# EAGLE schematic tranc_1 (EAGLE 6.5.0)
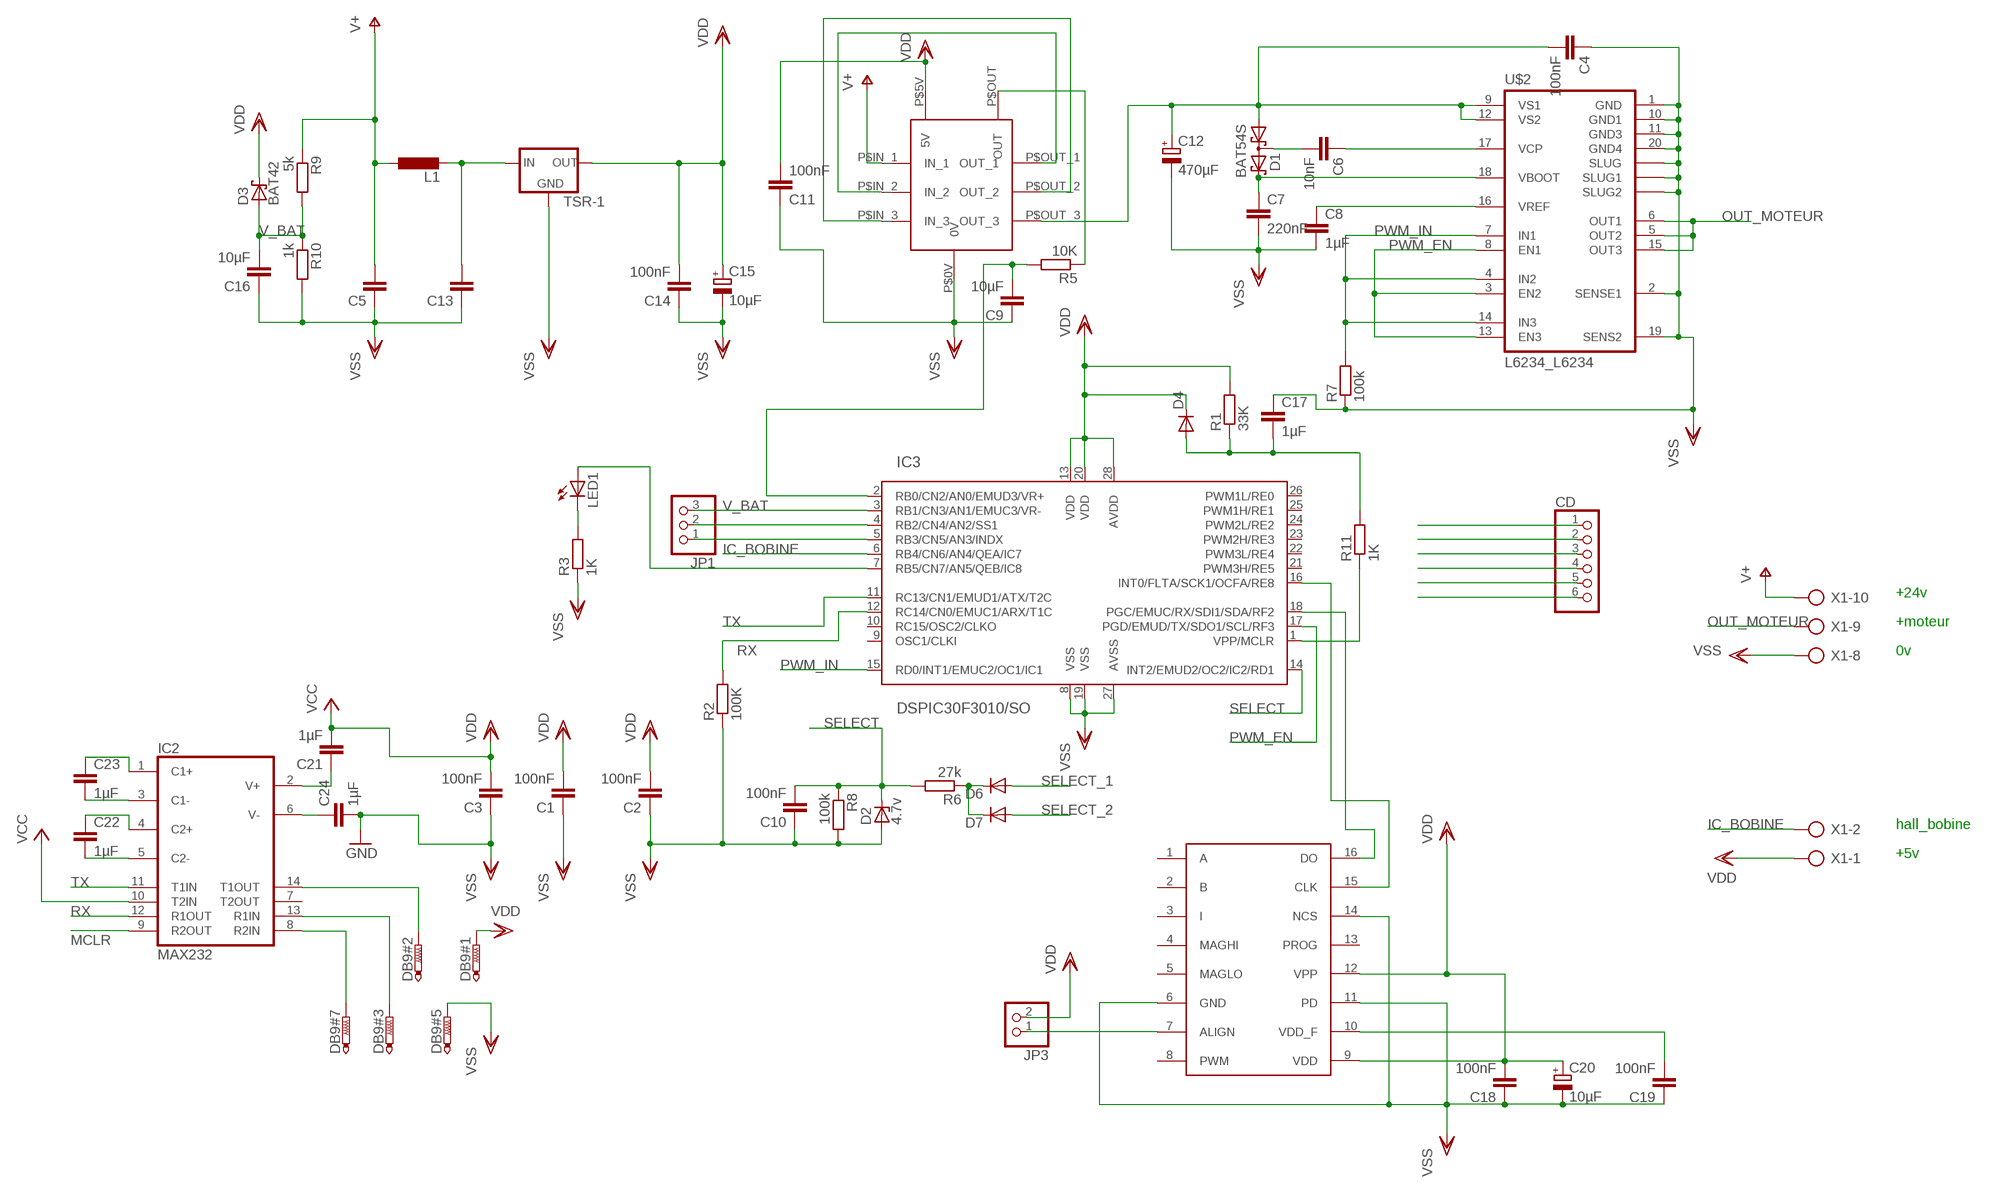
[diagram p0: schematic, sheet 1]

## Parts
C1  100nF  C-EUC0805K  [C0805K]
C2  100nF  C-EUC0805K  [C0805K]
C3  100nF  C-EUC0805K  [C0805K]
C4  100nF  C-EUC0805K  [C0805K]
C5  C-EUC1206K  [C1206K]
C6  10nF  C-EUC0805K  [C0805K]
C7  220nF  C-EUC0805K  [C0805K]
C8  1µF  C-EUC0805K  [C0805K]
C9  10µF  C-EUC1812  [C1812]
C10  100nF  C-EUC0805K  [C0805K]
C11  100nF  C-EUC0805K  [C0805K]
C12  470µF  CPOL-EUTT5D11L  [TT5D11L]
C13  C-EUC1206K  [C1206K]
C14  100nF  C-EUC0805K  [C0805K]
C15  10µF  CPOL-EUSMCB  [SMC_B]
C16  10µF  C-EUC0805K  [C0805K]
C17  1µF  C-EUC0805K  [C0805K]
C18  100nF  C-EUC0805K  [C0805K]
C19  100nF  C-EUC0805K  [C0805K]
C20  10µF  CPOL-EUSMCB  [SMC_B]
C21  1µF  C-EUC0805K  [C0805K]
C22  1µF  C-EUC0805K  [C0805K]
C23  1µF  C-EUC0805K  [C0805K]
C24  1µF  C-EUC0805K  [C0805K]
CD  PINHD-1X6  [1X06]
D1  BAT54S  [SOT23]
D2  4.7v  1N4728  [DO41Z10]
D3  BAT42  [DO35-10]
D4  DIODE-MINIMELF  [MINIMELF]
D6  DIODE-MINIMELF  [MINIMELF]
D7  DIODE-MINIMELF  [MINIMELF]
DB9#1  PTR1TP16SQ  [TP16SQ]
DB9#2  PTR1TP16SQ  [TP16SQ]
DB9#3  PTR1TP16SQ  [TP16SQ]
DB9#5  PTR1TP16SQ  [TP16SQ]
DB9#7  PTR1TP16SQ  [TP16SQ]
IC2  MAX232  [SO16]
IC3  DSPIC30F3010/SO  [SO-28W]
JP1  PINHD-1X3  [1X03]
JP3  PINHD-1X2  [1X02]
L1  L-EUL2012C  [L2012C]
LED1  LEDCHIPLED_1206  [CHIPLED_1206]
R1  33K  R-EU_M0805  [M0805]
R2  100K  R-EU_M0805  [M0805]
R3  1K  R-EU_M0805  [M0805]
R5  10K  R-EU_M0805  [M0805]
R6  27k  R-EU_M0805  [M0805]
R7  100k  R-EU_M0805  [M0805]
R8  100k  R-EU_M0805  [M0805]
R9  5k  R-EU_M0805  [M0805]
R10  1k  R-EU_M0805  [M0805]
R11  1K  R-EU_M0805  [M0805]
TSR-1  78XXS  [78XXS]
U$1  LTS25-NP  [LTS25]
U$2  L6234_L6234  [L6234_SO20POWER2]
U$3  AVAGO_AEAT-6600TSSOP16  [AVAGO_TSSOP16]
X1  AK300/10  [AK300/10]

## Nets
IC_BOBINE: IC3.6(RB4/CN6/AN4/QEA/IC7) X1.2
MCLR: IC2.9(R2OUT) IC3.1(VPP/MCLR) R11.1
N$1: C13.2 L1.2 TSR-1.IN
N$2: U$1.P$IN_2(IN_2) U$1.P$OUT_1(OUT_1)
N$3: IC3.16(INT0/FLTA/SCK1/OCFA/RE8) U$3.15(CLK)
N$4: CD.1
N$5: U$1.P$IN_3(IN_3) U$1.P$OUT_2(OUT_2)
N$6: IC3.7(RB5/CN7/AN5/QEB/IC8) LED1.A
N$7: C4.2 C12.+ D1.1(A1) U$1.P$OUT_3(OUT_3) U$2.9(VS1) U$2.12(VS2)
N$8: R5.1 U$1.P$OUT(OUT)
N$9: C17.2 D4.A R1.1 R11.2
N$10: C6.2 D1.3(C1A2)
N$11: C6.1 U$2.17(VCP)
N$12: C7.1 D1.2(C2) U$2.18(VBOOT)
N$13: C8.1 U$2.16(VREF)
N$14: JP3.1 U$3.7(ALIGN)
N$15: CD.2
N$16: D6.C D7.C R6.1
N$17: IC3.18(PGC/EMUC/RX/SDI1/SDA/RF2) U$3.16(DO)
N$18: CD.3
N$19: CD.4
N$20: CD.5
N$21: CD.6
N$23: LED1.C R3.2
N$24: IC3.4(RB2/CN4/AN2/SS1) JP1.2
N$25: IC3.5(RB3/CN5/AN3/INDX) JP1.1
N$27: C23.1 IC2.1(C1+)
N$28: C23.2 IC2.3(C1-)
N$29: C22.2 IC2.5(C2-)
N$30: C9.2 IC3.2(RB0/CN2/AN0/EMUD3/VR+) R5.2
N$31: C19.2 U$3.10(VDD_F)
N$32: C22.1 IC2.4(C2+)
N$33: C21.1 IC2.2(V+)
N$34: C24.1 IC2.6(V-)
N$35: DB9#2.TP IC2.14(T1OUT)
N$36: DB9#3.TP IC2.13(R1IN)
N$37: DB9#7.TP IC2.8(R2IN)
OUT_MOTEUR: U$2.5(OUT2) U$2.6(OUT1) U$2.15(OUT3) X1.9
PWM_EN: IC3.17(PGD/EMUD/TX/SDO1/SCL/RF3) U$2.3(EN2) U$2.8(EN1) U$2.13(EN3)
PWM_IN: IC3.15(RD0/INT1/EMUC2/OC1/IC1) R7.2 U$2.4(IN2) U$2.7(IN1) U$2.14(IN3)
RX: IC2.12(R1OUT) IC3.12(RC14/CN0/EMUC1/ARX/T1C) R2.2
SELECT: C10.2 D2.C IC3.14(INT2/EMUD2/OC2/IC2/RD1) R6.2 R8.1
SELECT_1: D6.A
SELECT_2: D7.A
TX: IC2.11(T1IN) IC3.11(RC13/CN1/EMUD1/ATX/T2C)
V+: C5.2 L1.1 R9.1 U$1.P$IN_1(IN_1) X1.10
V_BAT: C16.2 D3.A IC3.3(RB1/CN3/AN1/EMUC3/VR-) JP1.3 R9.2 R10.1
VCC: IC2.10(T2IN)
VDD: C1.2 C2.2 C3.2 C11.2 C14.2 C15.+ C18.2 C20.+ C21.2 D3.C D4.C DB9#1.TP IC3.13(VDD) IC3.20(VDD) IC3.28(AVDD) JP3.2 R1.2 TSR-1.OUT U$1.P$5V(5V) U$3.9(VDD) U$3.12(VPP) X1.1 ; supply symbol labelled VCC
VSS: C1.1 C2.1 C3.1 C4.1 C5.1 C7.2 C8.2 C9.1 C10.1 C11.1 C12.- C13.1 C14.1 C15.- C16.1 C17.1 C18.1 C19.1 C20.- C24.2 D2.A DB9#5.TP IC3.8(VSS) IC3.19(VSS) IC3.27(AVSS) R2.1 R3.1 R7.1 R8.2 R10.2 TSR-1.GND U$1.P$0V(0V) U$2.1(GND) U$2.2(SENSE1) U$2.10(GND1) U$2.11(GND3) U$2.19(SENS2) U$2.20(GND4) U$2.SLUG1(SLUG2) U$2.SLUG2(SLUG) U$2.SLUG(SLUG1) U$3.6(GND) U$3.11(PD) U$3.14(NCS) X1.8 ; supply symbol labelled GND
Unconnected: IC2.7(T2OUT) IC3.9(OSC1/CLKI) IC3.10(RC15/OSC2/CLKO) IC3.21(PWM3H/RE5) IC3.22(PWM3L/RE4) IC3.23(PWM2H/RE3) IC3.24(PWM2L/RE2) IC3.25(PWM1H/RE1) IC3.26(PWM1L/RE0) U$3.1(A) U$3.2(B) U$3.3(I) U$3.4(MAGHI) U$3.5(MAGLO) U$3.8(PWM) U$3.13(PROG) X1.3 X1.4 X1.5 X1.6 X1.7

## Notes on the sheet
- +24v
- +moteur
- 0v
- hall_bobine
- +5v

## Power pins joined to a net without a drawn wire
VDD: IC2.16(VCC)
VSS: IC2.15(GND)

## Library data of the parts
C1-C11 C13 C14 C16-C19 C21-C24 = rcl:C-EU: CAPACITOR, European symbol
C12 C15 C20 = rcl:CPOL-EU: POLARIZED CAPACITOR, European symbol
CD = pinhead:PINHD-1X6: PIN HEADER
D1 = diode:BAT54S: Schottky Diodes Pin connection corrected 2011-05-04 Source: Fairchild .. BAT54.pdf
D2 = diode:1N4728: Z DIODE 3.3 V, 1W, 5 percent
D3 = diode:BAT42: DIODE barrier diode
D4 D6 D7 = diode:DIODE-: DIODE
DB9#1-DB9#3 DB9#5 DB9#7 = testpad:PTR1: TEST PIN
IC2 = maxim:MAX232: RS232 TRANSCEIVER
IC3 = microchip-dspic:DSPIC30F3010: dsPIC Motion Controller DSC
JP1 = pinhead:PINHD-1X3: PIN HEADER
JP3 = pinhead:PINHD-1X2: PIN HEADER
L1 = rcl:L-EU: INDUCTOR, European symbol
LED1 = led:LED: LED OSRAM: - CHIPLED LG R971, LG N971, LY N971, LG Q971, LY Q971, LO R971, LY R971 LH N974, LH R974 LS Q976, LO Q976, LY Q976 LO Q996 - Hyper CHIPLED LW Q18S LB Q993, LB Q99A, LB R99A - SideLED LS A670, LO A670, LY A670, LG A670, LP A670 LB A673, LV A673, LT A673, LW A673 LH A674 LY A675 LS A676, LA A676, LO A676, LY A676, LW A676 LS A679, LY A679, LG A679 - Hyper Micro SIDELED® LS Y876, LA Y876, LO Y876, LY Y876 LT Y87S - SmartLED LW L88C, LW L88S LB L89C, LB L89S, LG L890 LS L89K, LO L89K, LY L89K LS L896, LA L896, LO L896, LY L896 - TOPLED LS T670, LO T670, LY T670, LG T670, LP T670 LSG T670, LSP T670, LSY T670, LOP T670, LYG T670 LG T671, LOG T671, LSG T671 LB T673, LV T673, LT T673, LW T673 LH T674 LS T676, LA T676, LO T676, LY T676, LB T676, LH T676, LSB T676, LW T676 LB T67C, LV T67C, LT T67C, LS T67K, LO T67K, LY T67K, LW E67C LS E67B, LA E67B, LO E67B, LY E67B, LB E67C, LV E67C, LT E67C LW T67C LS T679, LY T679, LG T679 LS T770, LO T770, LY T770, LG T770, LP T770 LB T773, LV T773, LT T773, LW T773 LH T774 LS E675, LA E675, LY E675, LS T675 LS T776, LA T776, LO T776, LY T776, LB T776 LHGB T686 LT T68C, LB T68C - Hyper Mini TOPLED® LB M676 - Mini TOPLED Santana® LG M470 LS M47K, LO M47K, LY M47K Source: http://www.osram.convergy.de LUXEON: - LUMILED® LXK2-PW12-R00, LXK2-PW12-S00, LXK2-PW14-U00, LXK2-PW14-V00 LXK2-PM12-R00, LXK2-PM12-S00, LXK2-PM14-U00 LXK2-PE12-Q00, LXK2-PE12-R00, LXK2-PE12-S00, LXK2-PE14-T00, LXK2-PE14-U00 LXK2-PB12-K00, LXK2-PB12-L00, LXK2-PB12-M00, LXK2-PB14-N00, LXK2-PB14-P00, LXK2-PB14-Q00 LXK2-PR12-L00, LXK2-PR12-M00, LXK2-PR14-Q00, LXK2-PR14-R00 LXK2-PD12-Q00, LXK2-PD12-R00, LXK2-PD12-S00 LXK2-PH12-R00, LXK2-PH12-S00 LXK2-PL12-P00, LXK2-PL12-Q00, LXK2-PL12-R00 Source: www.luxeon.com KINGBRIGHT: KA-3528ASYC Source: www.kingbright.com
R1-R3 R5-R11 = rcl:R-EU_: RESISTOR, European symbol
TSR-1 = v-reg:78XXS: VOLTAGE REGULATOR
U$1 = lem:LTS25-NP
U$2 = 009:L6234_L6234
U$3 = aeat_6600_1:AVAGO_AEAT-6600
X1 = con-ptr500:AK300/10: CONNECTOR; OC_FARNELL: unknown; OC_NEWARK: unknown